# Altium project PCB_Project_DATN.PrjPcb
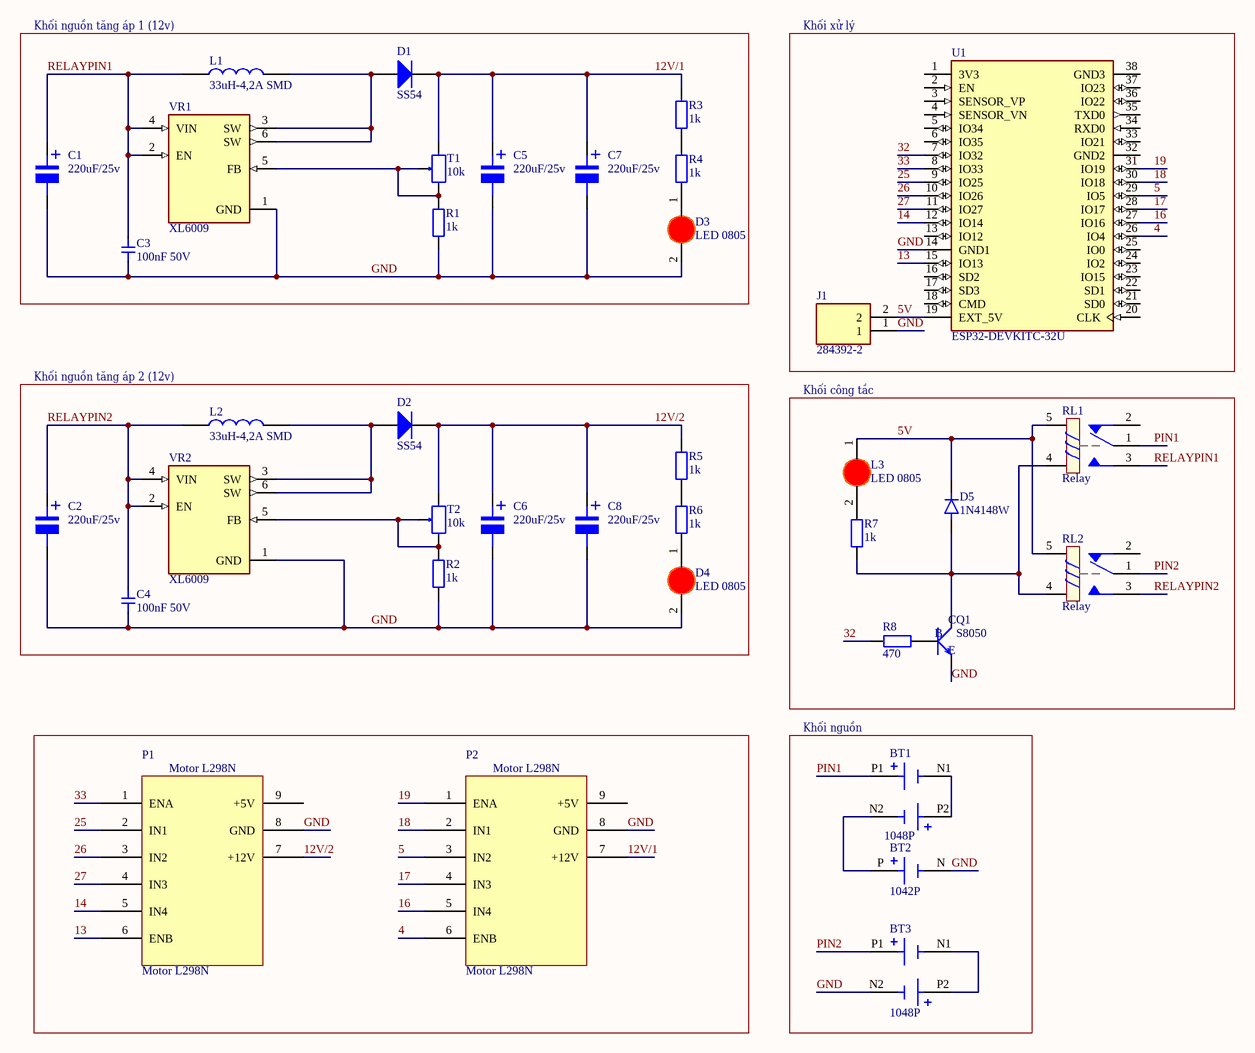
[diagram p0: Sheet.SchDoc]
1 sheet, 38 parts. Net scope: global (net labels, ports and power ports of the same name join across sheets).
Board file: PCB.PcbDoc

## Sheet Sheet.SchDoc: ROBOT PICKLEBALL
size 381 x 241 mm; DrawnBy: HA MINH HOANG; SheetNumber: 1; SheetTotal: 1

### Parts
BT1  1048P  [BAT_1048P]
BT2  1042P  [BAT_1042P]
BT3  1048P  [BAT_1048P]
C1  220uF/25v  [tu nhom 8 (f)]
C2  220uF/25v  [tu nhom 8 (f)]
C3  100nF 50V  [Cap 0805]
C4  100nF 50V  [Cap 0805]
C5  220uF/25v  [tu nhom 8 (f)]
C6  220uF/25v  [tu nhom 8 (f)]
C7  220uF/25v  [tu nhom 8 (f)]
C8  220uF/25v  [tu nhom 8 (f)]
D1  SS54  [DIODE SMA]
D2  SS54  [DIODE SMA]
D3  LED 0805  [LED-0805-Red]
D4  LED 0805  [LED-0805-Red]
D5  1N4148W  [SODFL3816X120N]
J1  284392-2  [TE_284392-2]
L1  33uH-4,2A SMD  [Cuon Cam 12x12x10]
L2  33uH-4,2A SMD  [Cuon Cam 12x12x10]
L3  LED 0805  [LED-0805-Red]
P1  Motor L298N  [L298N_Module]
P2  Motor L298N  [L298N_Module]
Q1  S8050  [SOT-23]
R1  1k  [tro smd 0805]
R2  1k  [tro smd 0805]
R3  1k  [tro smd 0805]
R4  1k  [tro smd 0805]
R5  1k  [tro smd 0805]
R6  1k  [tro smd 0805]
R7  1k  [tro smd 0805]
R8  470  [tro smd 0805]
RL1  Relay  [Relay 5 Chan SRD]
RL2  Relay  [Relay 5 Chan SRD]
T1  10k  [Bien Tro Vi Chinh Dung]
T2  10k  [Bien Tro Vi Chinh Dung]
U1  ESP32-DEVKITC-32U  [MODULE_ESP32-DEVKITC-32U]
VR1  XL6009  [DPAK170P1435X465-6N]
VR2  XL6009  [DPAK170P1435X465-6N]

### Blocks framed on the sheet
Khối nguồn tăng áp 1 (12v): C1 C3 C5 C7 D1 D3 L1 R1 R3 R4 T1 VR1
Khối xử lý: J1 U1
Khối nguồn tăng áp 2 (12v): C2 C4 C6 C8 D2 D4 L2 R2 R5 R6 T2 VR2
Khối công tắc: D5 L3 Q1 R7 R8 RL1 RL2
Khối nguồn: BT1-BT3

### Nets
4: P2.6(ENB) U1.26(IO4)
5: P2.3(IN2) U1.29(IO5)
5V: D5.C(K) J1.2 L3.1(A) RL1.5 RL2.5 U1.19(EXT_5V)
12V/1: C5.1 C7.1 D1.2(K) P2.7(+12V) R3.2 T1.3
12V/2: C6.1 C8.1 D2.2(K) P1.7(+12V) R5.2 T2.3
13: P1.6(ENB) U1.15(IO13)
14: P1.5(IN4) U1.12(IO14)
16: P2.5(IN4) U1.27(IO16)
17: P2.4(IN3) U1.28(IO17)
18: P2.2(IN1) U1.30(IO18)
19: P2.1(ENA) U1.31(IO19)
25: P1.2(IN1) U1.9(IO25)
26: P1.3(IN2) U1.10(IO26)
27: P1.4(IN3) U1.11(IO27)
32: R8.2 U1.7(IO32)
33: P1.1(ENA) U1.8(IO33)
GND: BT2.N(NEG) BT3.N2 C1.2 C2.2 C3.2 C4.2 C5.2 C6.2 C7.2 C8.2 D3.2(K) D4.2(K) J1.1 P1.8(GND) P2.8(GND) Q1.2(E) R1.1 R2.1 U1.14(GND1) VR1.1(GND) VR2.1(GND)
PIN1: BT1.P1 RL1.1
PIN2: BT3.P1 RL2.1
RELAYPIN1: C1.1 C3.1 L1.1 RL1.3 VR1.2(EN) VR1.4(VIN)
RELAYPIN2: C2.1 C4.1 L2.1 RL2.3 VR2.2(EN) VR2.4(VIN)
NetBT1_N1: BT1.N1 BT1.P2
NetBT1_N2: BT1.N2 BT2.P(POS)
NetBT3_N1: BT3.N1 BT3.P2
NetD1_1: D1.1(A) L1.2 VR1.3(SW) VR1.6(SW)
NetD2_1: D2.1(A) L2.2 VR2.3(SW) VR2.6(SW)
NetD3_1: D3.1(A) R4.1
NetD4_1: D4.1(A) R6.1
NetD5_A: D5.A Q1.3(C) R7.1 RL1.4 RL2.4
NetL3_2: L3.2(K) R7.2
NetQ1_1: Q1.1(B) R8.1
NetR1_2: R1.2 T1.1 T1.2 VR1.5(FB)
NetR2_2: R2.2 T2.1 T2.2 VR2.5(FB)
NetR3_1: R3.1 R4.2
NetR5_1: R5.1 R6.2

Not connected (* = marked no-connect by the designer): P1 9(+5V); P2 9(+5V); RL1 2; RL2 2; U1 1(3V3) 2(EN) 3(SENSOR_VP) 4(SENSOR_VN) 5(IO34) 6(IO35) 13(IO12) 16(SD2) 17(SD3) 18(CMD) 20(CLK) 21(SD0) 22(SD1) 23(IO15) 24(IO2) 25(IO0) 32(GND2) 33(IO21) 34(RXD0) 35(TXD0) 36(IO22) 37(IO23) 38(GND3)

### Notes on the sheet
- (in symbol Tu Nhom 220uF 25V) +

### Library data of the parts
BT1 BT3 = 1048P: SMT Polarized Holder for Dual 18650 Batteries; MF: Keystone Electronics; Value: *; MP: 1048P; Price: None; Package: None; Availability: In Stock; SnapEDA_Link: https://www.snapeda.com/parts/1048P/Keystone+Electronics/view-part/?ref=snap; Purchase-URL: https://pricing.snapeda.com/search/part/1048P/?ref=eda; Check_prices: https://www.snapeda.com/parts/1048P/Keystone+Electronics/view-part/?ref=eda
BT2 = 1042P: SMT Polarized Battery Holder for 18650 Battery | Keystone Electronics 1042P; SnapEDA_Link: https://www.snapeda.com/parts/1042P/Keystone/view-part/?ref=snap; Package: None; Value: *; MF: Keystone Electronics; MP: 1042P; Check_prices: https://www.snapeda.com/parts/1042P/Keystone/view-part/?ref=eda
C1 C2 C5-C8 = Tu Nhom 220uF 25V: Dán; Don_Vi: Con; So_Chan: 2; Ten_Linh_Kien: Tụ Nhôm 220uF 25V; Ma_Hang: MH002221; Chung_Loai: Dán; Kieu_Chan: *
C3 C4 = Cap 0805: Capacitor SMD 0805
D1 D2 = Diode SS34 ( 1N5822 ): Dán; Don_Vi: Con; Ma_Hang: MH002104; Ten_Linh_Kien: Diode SS34 3A 40V SMA ( 1N5822 SS34A); Kieu_Chan: *; Chung_Loai: Dán
D3 D4 L3 = LED 0805 Do: Dán; Don_Vi: Con; Ma_Hang: MH000897; Ten_Linh_Kien: LED 0805 Màu Đỏ (Red); Ghi_Chu: *; Kieu_Chan: *; Chung_Loai: Dán
D5 = 1N4148W: Small Signal Diode, SOD-123F, 100V, 0.15A, 150Â°C; MF: Diotec Semiconductor; SnapEDA_Link: https://www.snapeda.com/parts/1N4148W/Diotec/view-part/?ref=snap; Package: SOD-123F Diotec; Value: *; MP: 1N4148W; Check_prices: https://www.snapeda.com/parts/1N4148W/Diotec/view-part/?ref=eda
J1 = 284392-2: TERMI-BLOK PCB SIDE ENTRY STAC | TE Connectivity 284392-2; SnapEDA_Link: https://www.snapeda.com/parts/284392-2/TE+Connectivity+AMP+Connectors/view-part/?ref=snap; Package: None; Value: *; MF: TE Connectivity; MP: 284392-2; EU_RoHS_Compliance: Compliant with Exemptions; Check_prices: https://www.snapeda.com/parts/284392-2/TE+Connectivity+AMP+Connectors/view-part/?ref=eda
L1 L2 = CUON CAM 100uH SMD: Dán; Don_Vi: Con; Ma_Hang: MH003999; Ten_Linh_Kien: Cuộn Cảm 100uH 7x7x4MM CD74; Ma_Hang: *; Kieu_Chan: *; Chung_Loai: Dán
Q1 = SMD-TRANSISTORS-NPN-25V-500MW(SOT-23): Bipolar (BJT) Transistor NPN 25 V 500 mA 150MHz 300 mW Surface Mount SOT-23; MF: UMW; Purchase-URL: https://pricing.snapeda.com/search/part/S8050/?ref=eda; Check_prices: https://www.snapeda.com/parts/S8050/Umwelt+Sensor+Teknik/view-part/?ref=eda; SnapEDA_Link: https://www.snapeda.com/parts/S8050/Umwelt+Sensor+Teknik/view-part/?ref=snap; Price: None; Availability: In Stock; Package: None; MP: S8050; Value: *
R1-R8 = Tro 0805 1% 1k: Dán; Don_Vi: Con; So_Chan: 2; Ten_Linh_Kien: Trở 0805 1% 1k; Ma_Hang: MH005468; Chung_Loai: Dán; Kieu_Chan: *
RL1 RL2 = Relay 5 Chan SRD: Relay 5 Chan; Ma_Hang: MH009374; Ten: Relay 5V10A SRD-05VDC-SL-C Chính Hãng
T1 T2 = Bien Tro Tinh Chinh 10K Dung: Cắm; Ma_Hang: MH003232; Ten_Linh_Kien: Biến Trở VR 103-10K 3296W; Don_Vi: Con; Kieu_Chan: *; Chung_Loai: Cắm; Ghi_Chu: *
U1 = ESP32-DEVKITC-32U: ESP32-WROOM-32UE series Transceiver; 802.11 b/g/n (Wi-Fi, WiFi, WLAN), Bluetooth® Smart Ready 4.x Dual Mode Evaluation Board; MF: Espressif Systems; SnapEDA_Link: https://www.snapeda.com/parts/ESP32-DEVKITC-32U/Espressif+Systems/view-part/?ref=snap; Package: CUSTOM-38 ESPRESSIF; Value: *; MP: ESP32-DEVKITC-32U; Check_prices: https://www.snapeda.com/parts/ESP32-DEVKITC-32U/Espressif+Systems/view-part/?ref=eda
VR1 VR2 = XL6009: The XL6009 regulator is a wide input range, current mode, DC/DC converter which is capable of generating either positive or negative output voltages.; MF: XLSEMI; Package: TO-263-5L XLSEMI; Price: None; Value: *; SnapEDA_Link: https://www.snapeda.com/parts/XL6009/XLSEMI/view-part/?ref=snap; MP: XL6009; Availability: Not in stock; Check_prices: https://www.snapeda.com/parts/XL6009/XLSEMI/view-part/?ref=eda